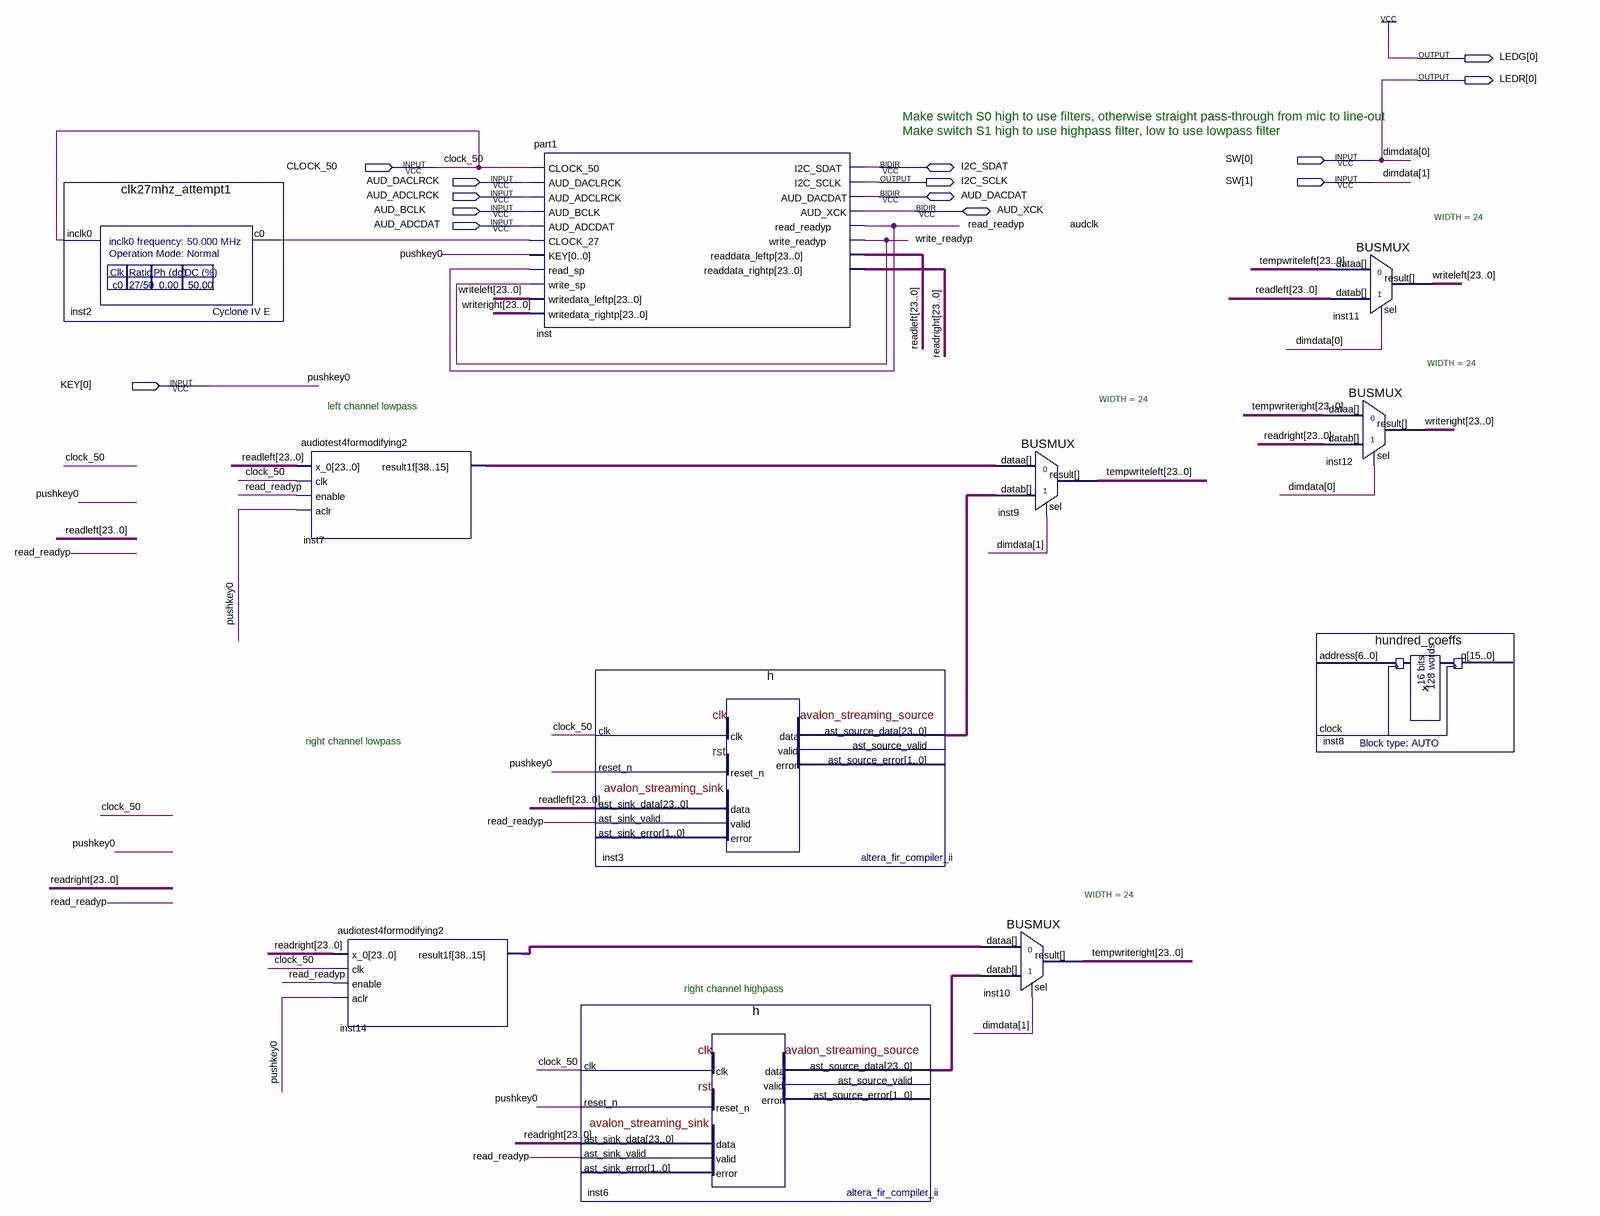
[diagram p0: schematic sheet]
// Quartus schematic block1.bdf as structural Verilog: 11 symbols, 14 pins
module block1 (
  input  [1:0] SW,
  input  CLOCK_50,
  input  AUD_DACLRCK,
  input  AUD_ADCLRCK,
  input  AUD_BCLK,
  input  AUD_ADCDAT,
  input  [0:0] KEY,
  inout  I2C_SDAT,
  inout  AUD_DACDAT,
  inout  AUD_XCK,
  output [0:0] LEDG,
  output [0:0] LEDR,
  output I2C_SCLK
);

  wire inst2_c0, read_readyp, write_readyp;
  wire [23:0] inst3_ast_source_data, inst6_ast_source_data, inst7_result1f, inst14_result1f, readleft,
       readright, tempwriteleft, tempwriteright, writeleft, writeright;

  clk27mhz_attempt1 inst2 (.inclk0(CLOCK_50), .c0(inst2_c0));
  audiotest4formodifying2 inst7 (
    .x_0(readleft), .clk(CLOCK_50), .enable(read_readyp), .aclr(KEY[0]), .result1f(inst7_result1f));
  audiotest4formodifying2 inst14 (
    .x_0(readright), .clk(CLOCK_50), .enable(read_readyp), .aclr(KEY[0]), .result1f(inst14_result1f));
  part1 inst (
    .CLOCK_50(CLOCK_50), .AUD_DACLRCK(AUD_DACLRCK), .AUD_ADCLRCK(AUD_ADCLRCK), .AUD_BCLK(AUD_BCLK),
    .AUD_ADCDAT(AUD_ADCDAT), .CLOCK_27(inst2_c0), .KEY(KEY[0]), .read_sp(read_readyp),
    .write_sp(write_readyp), .writedata_leftp(writeleft), .writedata_rightp(writeright), .I2C_SCLK(I2C_SCLK),
    .AUD_DACDAT(AUD_DACDAT), .AUD_XCK(AUD_XCK), .read_readyp(read_readyp), .write_readyp(write_readyp),
    .readdata_leftp(readleft), .readdata_rightp(readright), .I2C_SDAT(I2C_SDAT));
  h inst3 (
    .clk(CLOCK_50), .reset_n(KEY[0]), .ast_sink_data(readleft), .ast_sink_valid(read_readyp),
    .ast_source_data(inst3_ast_source_data));  // open: ast_sink_error, ast_source_valid, ast_source_error
  h inst6 (
    .clk(CLOCK_50), .reset_n(KEY[0]), .ast_sink_data(readright), .ast_sink_valid(read_readyp),
    .ast_source_data(inst6_ast_source_data));  // open: ast_sink_error, ast_source_valid, ast_source_error
  BUSMUX #(.WIDTH(24)) inst9 (
    .datab(inst3_ast_source_data), .sel(SW[1]), .dataa(inst7_result1f), .result(tempwriteleft));
  BUSMUX #(.WIDTH(24)) inst10 (
    .datab(inst6_ast_source_data), .sel(SW[1]), .dataa(inst14_result1f), .result(tempwriteright));
  BUSMUX #(.WIDTH(24)) inst11 (.datab(readleft), .sel(SW[0]), .dataa(tempwriteleft), .result(writeleft));
  BUSMUX #(.WIDTH(24)) inst12 (.datab(readright), .sel(SW[0]), .dataa(tempwriteright), .result(writeright));
  hundred_coeffs inst8 ();  // open: address, clock, q

  assign LEDG[0] = 1'b1;
  assign LEDR[0] = SW[0];

  // Other names for the same wires on the sheet: audclk = AUD_XCK; dimdata[1:0] = SW; pushkey0 = KEY[0]

  // Notes on the sheet:
  //   Make switch S0 high to use filters, otherwise straight pass-through from mic to line-out
  //   Make switch S1 high to use highpass filter, low to use lowpass filter
  //   left channel lowpass
  //   right channel lowpass
  //   right channel highpass
endmodule
